# EasyEDA Pro project qsfp-booster.epro, board PCB1
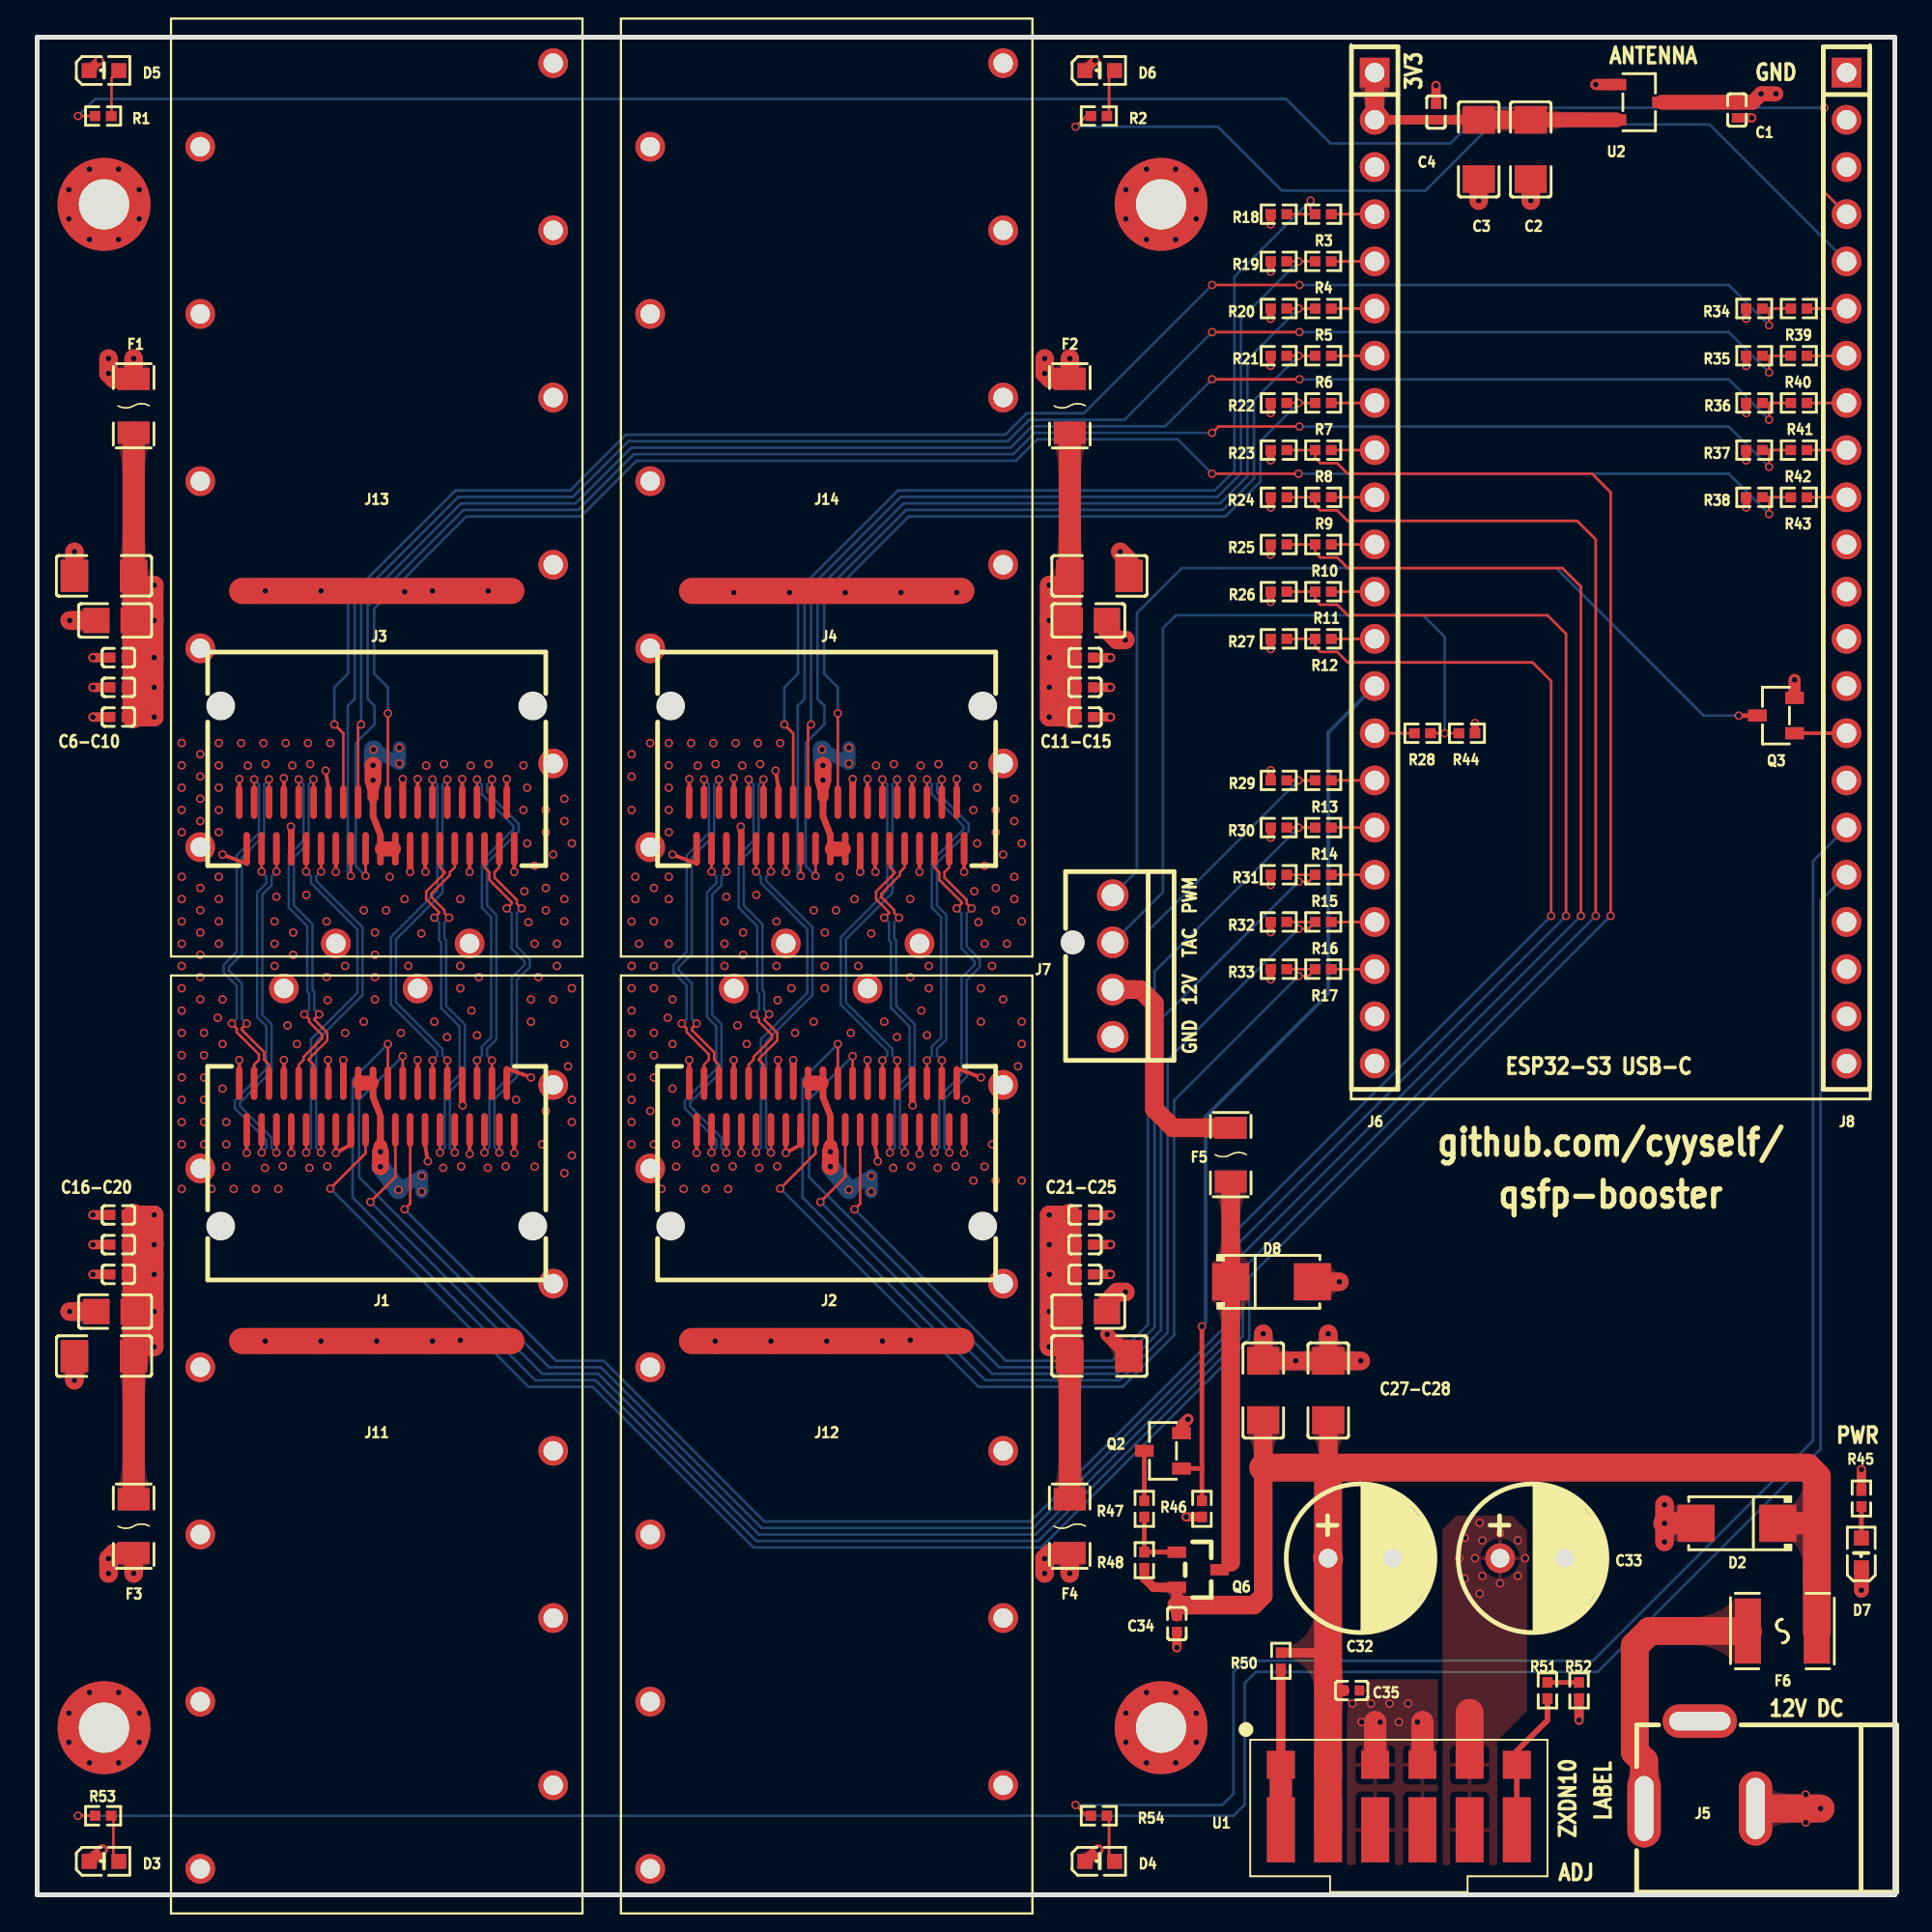
[diagram p1: board, top side]
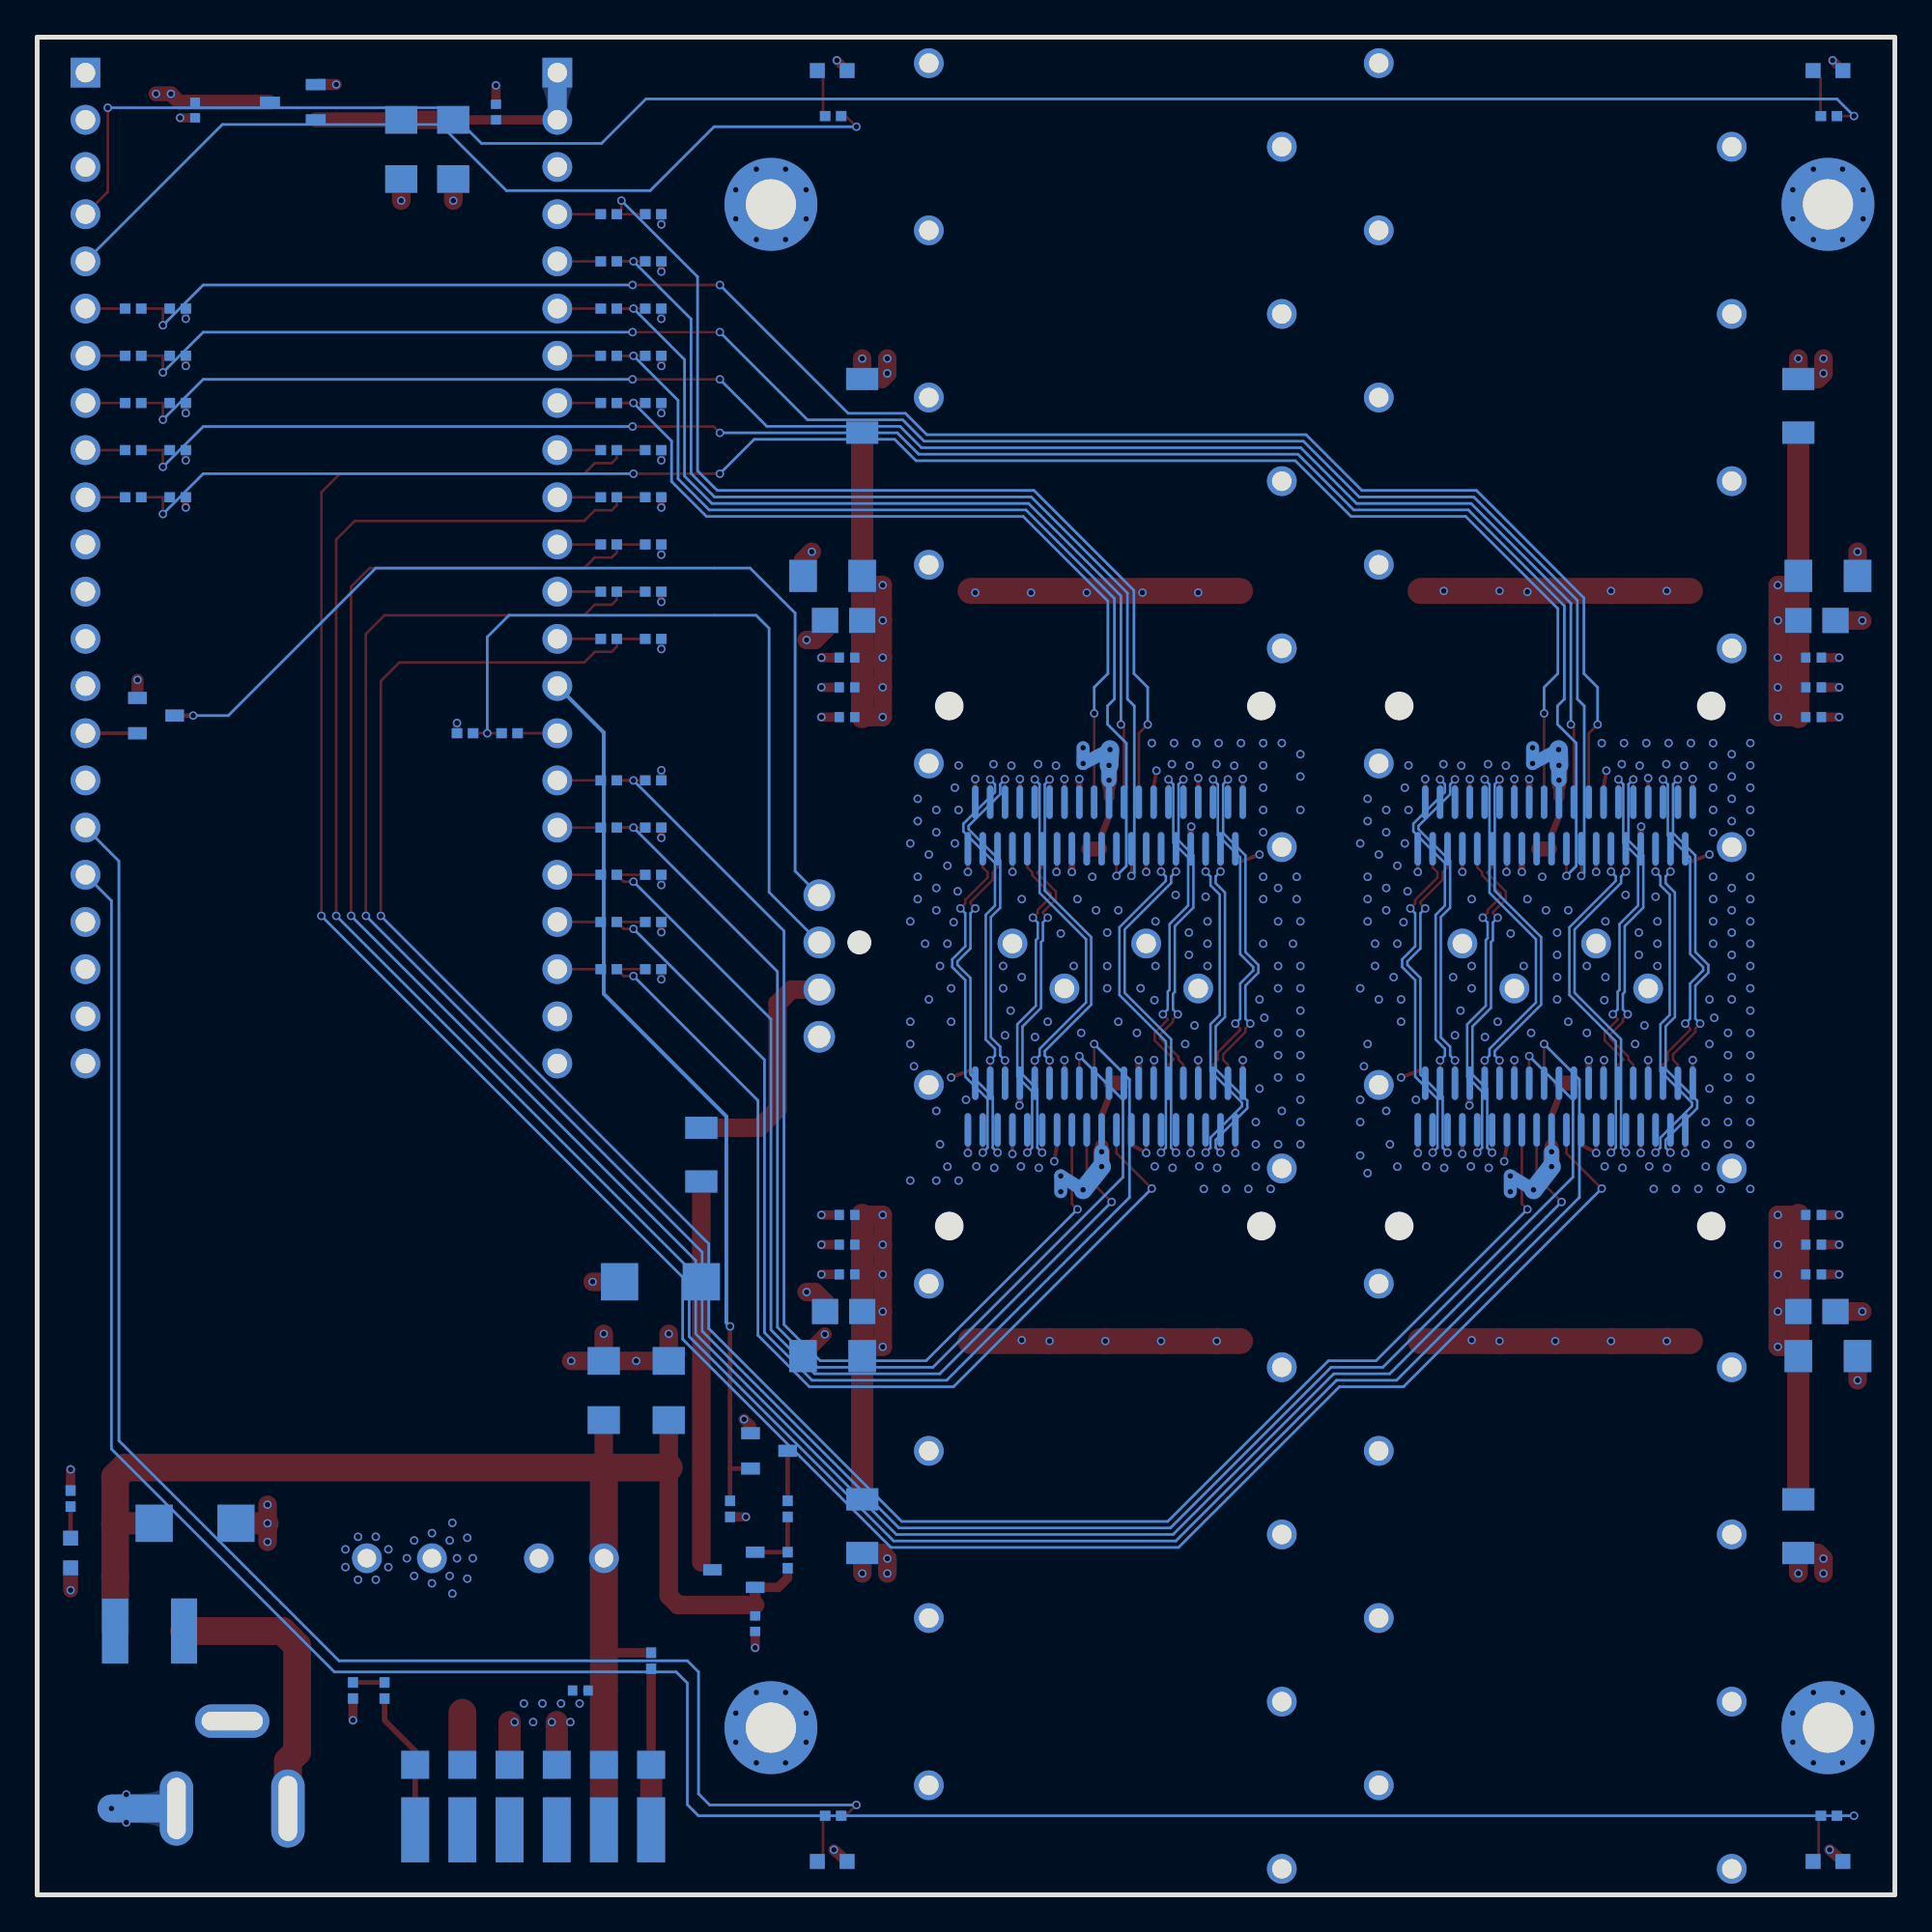
[diagram p2: board, bottom side, seen from below]

Outline 100 x 100 mm; copper layers: Top Layer, Inner1, Inner2, Bottom Layer. Coordinates in mm from the lower left corner of the outline.
Outline path: 0,100 100,100 100,0 0,0 0,100
Stack: Top Layer 0.035mm / Dielectric1 1.51mm FR4 er 4.5 / Bottom Layer 0.035mm

## Design rules (mm)
spacing copperThickness1oz (default): track to track 0.102, other pairs 0.152 to 0.3
spacing copperThickness2oz: track to track 0.203, other pairs 0.152 to 0.3
track width copperThickness1oz (default): min 0.09, default 0.2, max 2.54
track width copperThickness2oz: min 0.203, default 0.254, max 2.54
track width power: min 0.09, default 0.5, max 2.54
differential pair differentialPair (default): width min 0.13, default 0.13, max 0.13; gap min 0.15, default 0.15
net VCC_OPT1 uses power
net VCC_OPT2 uses power
net +12V uses power
net +3V3 uses power
net +12V_JACK uses power
net VCC_DAC1 uses power
net VCC_DAC2 uses power

## Placement (name value [footprint] x y rotation side)
C1  100nF  [C0402]  91.5 96.08 270 top
C2  47uF  [C1206]  80.4 93.96 270 top
C3  47uF  [C1206]  77.6 93.96 270 top
C4  100nF  [C0402]  75.3 95.97 90 top
C6  47uF  [C1206]  3.6 71 180 top
C7  10uF  [C0805]  4.19 68.6 180 top
C8  100nF  [C0402]  4.38 66.6 180 top
C9  100nF  [C0402]  4.37 65 180 top
C10  100nF  [C0402]  4.37 63.4 180 top
C11  47uF  [C1206]  57.18 71 0 top
C12  10uF  [C0805]  56.59 68.6 0 top
C13  100nF  [C0402]  56.41 66.6 0 top
C14  100nF  [C0402]  56.41 65 0 top
C15  100nF  [C0402]  56.41 63.4 0 top
C16  100nF  [C0402]  4.37 36.6 180 top
C17  100nF  [C0402]  4.37 35 180 top
C18  100nF  [C0402]  4.38 33.4 180 top
C19  10uF  [C0805]  4.19 31.4 180 top
C20  47uF  [C1206]  3.6 29 180 top
C21  100nF  [C0402]  56.4 36.6 0 top
C22  100nF  [C0402]  56.4 35 0 top
C23  100nF  [C0402]  56.4 33.4 0 top
C24  10uF  [C0805]  56.58 31.4 0 top
C25  47uF  [C1206]  57.18 29 0 top
C27  22uF  [C1206]  66 27.15 90 top
C28  22uF  [C1206]  69.5 27.15 90 top
C32  470uF  [CAP-TH_BD8.0-P3.50-D1.0-FD]  71.24 18.12 0 top
C33  470uF  [CAP-TH_BD8.0-P3.50-D1.0-FD]  80.5 18.12 0 top
C34  100nF  [C0402]  61.35 14.6 270 top
C35  100nF  [C0402]  70.76 11 0 top
D2  D  [SMA_L4.3-W2.6-LS5.2-RD]  91.5 20 180 top
D3  KT-0603W  [LED0603-R-RD_WHITE]  3.6 1.8 0 top
D4  KT-0603W  [LED0603-R-RD_WHITE]  57.2 1.8 0 top
D5  KT-0603W  [LED0603-R-RD_WHITE]  3.6 98.2 0 top
D6  KT-0603W  [LED0603-R-RD_WHITE]  57.2 98.2 0 top
D7  KT-0603W  [LED0603-R-RD_WHITE]  98.2 18.4 90 top
D8  D  [SMA_L4.3-W2.6-LS5.2-RD]  66.45 33 0 top
F1  Polyfuse  [F1206]  5.19 80.16 270 top
F2  Polyfuse  [F1206]  55.59 80.16 270 top
F3  Polyfuse  [F1206]  5.19 19.84 90 top
F4  Polyfuse  [F1206]  55.58 19.84 90 top
F5  SMD1206-100C-24V  [F1206]  64.25 39.85 90 top
F6  SMD1812P260TF/16  [F1812]  93.95 14.2 0 top
J1  QSFP28_Receptacle  [CONN-SMD_QSFP-1888971-1]  18.28 42.44 0 top
J2  QSFP28_Receptacle  [CONN-SMD_QSFP-1888971-1]  42.5 42.44 0 top
J3  QSFP28_Receptacle  [CONN-SMD_QSFP-1888971-1]  18.28 57.56 180 top
J4  QSFP28_Receptacle  [CONN-SMD_QSFP-1888971-1]  42.5 57.56 180 top
J5  Barrel_Jack_Switch  [DC-IN-TH_DC-005-5A-2.0]  89.5 7 180 top
J6  HC-PM254-8.5H-1x22PZ  [HDR-TH_22P-P2.54-V-F]  72 71.42 270 top
J7  Fan_4pin  [CONN-TH_47053-1000]  57.9 50 270 top
J8  HC-PM254-8.5H-1x22PZ  [HDR-TH_22P-P2.54-V-F]  97.4 71.42 270 top
J11  CAGE_DAC1  [QSFP_Cage_SFF8663]  18.28 36 0 top
J12  CAGE_DAC2  [QSFP_Cage_SFF8663]  42.5 36 0 top
J13  CAGE_OPT1  [QSFP_Cage_SFF8663]  18.28 64 180 top
J14  CAGE_OPT2  [QSFP_Cage_SFF8663]  42.5 64 180 top
NOREF  -  [Pad_e207]  3.6 9 0 top
NOREF#2  -  [Pad_e208]  3.6 91 0 top
NOREF#3  -  [Pad_e210]  60.5 91 0 top
NOREF#4  -  [Pad_e209]  60.5 9 0 top
Q2  NMOS_GSD  [SOT-23-3_L2.9-W1.3-P1.90-LS2.4-BR]  60.6 23.9 0 top
Q3  NMOS_GSD  [SOT-23-3_L2.9-W1.3-P1.90-LS2.4-BR]  93.6 63.48 0 top
Q6  AO3407A  [SOT-23_L2.9-W1.3-P1.90-LS2.4-BR]  62.5 17.5 180 top
R1  330Ω  [R0402]  3.55 95.75 0 top
R2  330Ω  [R0402]  57.15 95.75 0 top
R3  100Ω  [R0402]  69.23 90.47 0 top
R4  100Ω  [R0402]  69.23 87.93 0 top
R5  100Ω  [R0402]  69.23 85.39 0 top
R6  100Ω  [R0402]  69.23 82.85 0 top
R7  100Ω  [R0402]  69.23 80.31 0 top
R8  100Ω  [R0402]  69.23 77.77 0 top
R9  100Ω  [R0402]  69.23 75.23 0 top
R10  100Ω  [R0402]  69.23 72.69 0 top
R11  100Ω  [R0402]  69.23 70.15 0 top
R12  100Ω  [R0402]  69.23 67.61 0 top
R13  100Ω  [R0402]  69.23 59.99 0 top
R14  100Ω  [R0402]  69.23 57.45 0 top
R15  100Ω  [R0402]  69.23 54.91 0 top
R16  100Ω  [R0402]  69.23 52.37 0 top
R17  100Ω  [R0402]  69.23 49.83 0 top
R18  4.7kΩ  [R0402]  66.83 90.47 0 top
R19  4.7kΩ  [R0402]  66.83 87.93 0 top
R20  4.7kΩ  [R0402]  66.83 85.39 0 top
R21  4.7kΩ  [R0402]  66.83 82.85 0 top
R22  4.7kΩ  [R0402]  66.83 80.31 0 top
R23  4.7kΩ  [R0402]  66.83 77.77 0 top
R24  4.7kΩ  [R0402]  66.83 75.23 0 top
R25  4.7kΩ  [R0402]  66.83 72.69 0 top
R26  4.7kΩ  [R0402]  66.83 70.15 0 top
R27  4.7kΩ  [R0402]  66.83 67.61 0 top
R28  4.7kΩ  [R0402]  74.57 62.53 180 top
R29  4.7kΩ  [R0402]  66.83 59.99 0 top
R30  4.7kΩ  [R0402]  66.83 57.45 0 top
R31  4.7kΩ  [R0402]  66.83 54.91 0 top
R32  4.7kΩ  [R0402]  66.83 52.37 0 top
R33  4.7kΩ  [R0402]  66.83 49.83 0 top
R34  4.7kΩ  [R0402]  92.43 85.39 0 top
R35  4.7kΩ  [R0402]  92.43 82.85 0 top
R36  4.7kΩ  [R0402]  92.43 80.31 0 top
R37  4.7kΩ  [R0402]  92.43 77.77 0 top
R38  4.7kΩ  [R0402]  92.43 75.23 0 top
R39  100Ω  [R0402]  94.83 85.39 0 top
R40  100Ω  [R0402]  94.83 82.85 0 top
R41  100Ω  [R0402]  94.83 80.31 0 top
R42  100Ω  [R0402]  94.83 77.77 0 top
R43  100Ω  [R0402]  94.83 75.23 0 top
R44  4.7kΩ  [R0402]  76.97 62.53 180 top
R45  330Ω  [R0402]  98.2 21.33 270 top
R46  4.7kΩ  [R0402]  62.7 20.78 270 top
R47  4.7kΩ  [R0402]  59.6 20.78 90 top
R48  4.7kΩ  [R0402]  59.6 18.02 270 top
R50  4.7kΩ  [R0402]  66.95 12.6 270 top
R51  330Ω  [R0402]  81.3 11 90 top
R52  47Ω  [R0402]  83 11 270 top
R53  330Ω  [R0402]  3.55 4.26 0 top
R54  330Ω  [R0402]  57.15 4.26 0 top
U1  ZXDN10S1205SAW  [COMM-SMD_ZXDN10S1205SAW]  73.3 5.25 0 top
U2  CH213K  [SOT-23-3_L2.9-W1.6-P1.90-LS2.8-BR]  86.24 96.5 180 top

## Footprints (pads in the part's own frame, mm; a bottom-side part is the same pattern mirrored in y, then rotated)
C0402
  rect 0.5x0.54 hole 0.001: 1(-0.42,0) 2(0.42,0)
C0805
  rect 1.41x1.35 hole 0.001: 1(-1,0) 2(1,0)
C1206
  rect 1.485x1.728 hole 0.001: 1(-1.593,0) 2(1.593,0)
CAP-TH_BD8.0-P3.50-D1.0-FD
  round 1.6 hole 1: 1(-1.75,0) 2(1.75,0)
COMM-SMD_ZXDN10S1205SAW
  rect 1.5x1.5 hole 0.001: 1(-6.35,1.75) 2(-3.81,1.75) 3(-1.27,1.75) 4(1.27,1.75) 5(3.81,1.75) 6(6.35,1.75)
  rect 1.5x3.5 hole 0.001: 1(-6.35,-1.75) 2(-3.81,-1.75) 3(-1.27,-1.75) 4(1.27,-1.75) 5(3.81,-1.75) 6(6.35,-1.75)
CONN-SMD_QSFP-1888971-1
  oval 0.35x1.8 hole 0.001: 1(-7,-1.255) 2(-6.2,-1.255) 3(-5.4,-1.255) 4(-4.6,-1.255) 5(-3.8,-1.255) 6(-3,-1.255) 7(-2.2,-1.255) 8(-1.4,-1.255) 9(-0.6,-1.255) 10(0.2,-1.255) 11(1,-1.255) 12(1.8,-1.255) 13(2.6,-1.255) 14(3.4,-1.255) 15(4.2,-1.255) 16(5,-1.255) 17(5.8,-1.255) 18(6.6,-1.255) 19(7.4,-1.255) 20(7,1.255) 21(6.2,1.255) 22(5.4,1.255) 23(4.6,1.255) 24(3.8,1.255) 25(3,1.255) 26(2.2,1.255) 27(1.4,1.255) 28(0.6,1.255) 29(-0.2,1.255) 30(-1,1.255) 31(-1.8,1.255) 32(-2.6,1.255) 33(-3.4,1.255) 34(-4.2,1.255) 35(-5,1.255) 36(-5.8,1.255) 37(-6.6,1.255) 38(-7.4,1.255)
CONN-TH_47053-1000
  round 1.7 hole 1.2: 1(3.81,0) 2(1.27,0) 3(-1.27,0) 4(-3.81,0)
DC-IN-TH_DC-005-5A-2.0
  oval 1.8x4.2 hole 1x3.5: 1(3,2.352)
  oval 1.8x4 hole 1x3.3: 2(-3,2.352)
  oval 4x1.8 hole 3.3x1: 3(-0.001,-2.352)
F1206
  rect 1.19x1.728 hole 0.001: 1(-1.445,0) 2(1.445,0)
F1812
  rect 1.407x3.499 hole 0.001: 1(-1.853,0) 2(1.853,0)
HDR-TH_22P-P2.54-V-F
  rect 1.6x1.6 hole 1.05: 1(-26.67,0)
  round 1.6 hole 1.05: 2(-24.13,0) 3(-21.59,0) 4(-19.05,0) 5(-16.51,0) 6(-13.97,0) 7(-11.43,0) 8(-8.89,0) 9(-6.35,0) 10(-3.81,0) 11(-1.27,0) 12(1.27,0) 13(3.81,0) 14(6.35,0) 15(8.89,0) 16(11.43,0) 17(13.97,0) 18(16.51,0) 19(19.05,0) 20(21.59,0) 21(24.13,0) 22(26.67,0)
LED0603-R-RD_WHITE
  rect 0.8x0.8 hole 0.001: 1(0.8,0) 2(-0.8,0)
Pad_e207
  round 5.002 hole 2.7: MH1(0,0)
Pad_e208
  round 5.002 hole 2.7: MH2(0,0)
Pad_e209
  round 5 hole 2.7: MH3(0,0)
Pad_e210
  round 5.002 hole 2.7: MH4(0,0)
QSFP_Cage_SFF8663
  round 1.6 hole 1.05: 1(-9.5,3.1) 1(-9.5,-7.6) 1(-9.5,-16.6) 1(-9.5,-25.6) 1(-9.5,-34.6) 1(-5,12.79) 1(2.2,12.79) 1(9.5,7.6) 1(9.5,-3.1) 1(9.5,-12.1) 1(9.5,-21.1) 1(9.5,-30.1)
R0402
  rect 0.566x0.54 hole 0.001: 1(-0.433,0) 2(0.433,0)
SMA_L4.3-W2.6-LS5.2-RD
  rect 2x2 hole 0.001: 1(-2.2,0) 2(2.2,0)
SOT-23-3_L2.9-W1.3-P1.90-LS2.4-BR
  rect 1x0.65 hole 0.001: 1(1,-0.95) 2(1,0.95) 3(-1,0)
SOT-23-3_L2.9-W1.6-P1.90-LS2.8-BR
  rect 1.07x0.6 hole 0.001: 1(1.235,-0.95) 2(1.235,0.95) 3(-1.235,0)
SOT-23_L2.9-W1.3-P1.90-LS2.4-BR
  rect 1x0.6 hole 0.001: 1(1.15,-0.95) 2(1.15,0.95) 3(-1.15,0)

## Nets
As in the schematic, except:
+12V: C27.1 C28.1 C32.1 C34.1 C35.1 D2.1 F6.2 Q6.2 R48.2 R50.1 U1.2
GND: C1.2 C2.2 C3.2 C4.2 C6.2 C7.2 C8.2 C9.2 C10.2 C11.2 C12.2 C13.2 C14.2 C15.2 C16.2 C17.2 C18.2 C19.2 C20.2 C21.2 C22.2 C23.2 C24.2 C25.2 C27.2 C28.2 C32.2 C33.2 C34.2 C35.2 D2.2 D3.2 D4.2 D5.2 D6.2 D7.2 D8.2 J1.1 J1.4 J1.7 J1.8 J1.13 J1.16 J1.19 J1.20 J1.23 J1.26 J1.31 J1.32 J1.35 J1.38 J2.1 J2.4 J2.7 J2.8 J2.13 J2.16 J2.19 J2.20 J2.23 J2.26 J2.31 J2.32 J2.35 J2.38 J3.1 J3.4 J3.7 J3.8 J3.13 J3.16 J3.19 J3.20 J3.23 J3.26 J3.31 J3.32 J3.35 J3.38 J4.1 J4.4 J4.7 J4.8 J4.13 J4.16 J4.19 J4.20 J4.23 J4.26 J4.31 J4.32 J4.35 J4.38 J5.2 J5.3 J6.22 J7.1 J8.1 J8.21 J8.22 J11.1 J12.1 J13.1 J14.1 NOREF.MH1 NOREF#2.MH2 NOREF#3.MH4 NOREF#4.MH3 Q2.2 Q3.2 R46.2 R52.2 U1.3 U1.4 U2.1
FAN_12V_Q: D8.1 F5.1 Q6.3

Pads without a net: J6 3 21; J8 2 3 11 12 13 14 16 19 20

## Via types
v1: diameter 0.452, hole 0.3, Top Layer to Bottom Layer, 547 vias
v2: diameter 0.452, hole 0.299, Top Layer to Bottom Layer, 60 vias
v3: diameter 0.45, hole 0.3, Top Layer to Bottom Layer, 51 vias

## Routing (per net, layer and track width the routed paths; a pad name or vN(x,y) marks a point on that pad's centre or on a via; arc(x,y) is an arc through that point)
+3V3: length 35.3
  Top Layer w0.4: R32.1 v3(66.4,51.82) ; R35.1 v3(92,82.3) ; R33.1 v3(66.4,49.28) ; R19.1 v3(66.4,87.38) ; R36.1 v3(92,79.76) ; R18.1 v3(66.4,89.92) ; R25.1 v3(66.4,72.14) ; R29.1 v3(66.4,60.54) ; R38.1 v3(92,74.68) ; R44.1 v3(77.4,63.08) ; R23.1 v3(66.4,77.22) ; R31.1 v3(66.4,54.36) ; R20.1 v3(66.4,84.84) ; R21.1 v3(66.4,82.3) ; R34.1 v3(92,84.84) ; R37.1 v3(92,77.22) ; R30.1 v3(66.4,56.9) ; R26.1 v3(66.4,69.6) ; R27.1 v3(66.4,67.06) ; R22.1 v3(66.4,79.76) ; R24.1 v3(66.4,74.68)
  Top Layer w0.5: 98.2,21.76 v3(98.2,22.9)
  Top Layer w0.8: 87.47,96.5 C1.1 92.35,96.5 v1(92.8,96.95) v1(93.6,96.95)
  Top Layer w1: v1(5.19,17.3) 5.19,18.4 4.14,18.4 v1(3.84,18.1) v1(3.84,17.3) ; v1(54.24,82.7) v1(54.24,81.9) 54.54,81.6 F2.1 v1(55.59,82.7) ; v1(55.58,17.3) F4.1 54.53,18.4 v1(54.23,18.1) v1(54.23,17.3) ; v1(5.19,82.7) 5.19,81.6 4.14,81.6 v1(3.84,81.9) v1(3.84,82.7)
  Top Layer w1.5: 77.11,7 77.11,9.8
  vias: v2(76.55,18.12) v2(76.84,19.22) v2(76.84,17.02) v2(77.4,18.12) v2(77.65,20.03) v2(77.65,16.22) v2(77.79,19.07) v2(77.79,17.16) v2(78.75,19.47) v2(78.75,16.77) v2(79.71,19.07) v2(79.71,17.16) v2(80.1,18.12)
+12V: length 84.2
  Top Layer w0.5: 66.95,13.03 69.49,13.03 ; 61.35,16.55 60.1,16.55 59.6,17.05 59.6,17.58
  Top Layer w0.6: 69.49,11 C35.1 ; 61.35,16.55 61.35,15.02
  Top Layer w1: 66,25.56 66,16.1 65.5,15.6 61.35,15.6 ; 69.5,25.56 69.5,23
  Top Layer w1.2: 93.7,20 95.8,20
  Top Layer w1.5: 69.49,23 69.49,18.12 69.49,13.03 U1.2 U1.2 ; 69.49,23 95.3,23 95.8,22.5 95.8,17.1 F6.2 ; 69.49,23 66,23
+12V_JACK: length 15.4
  Top Layer w1.5: 92.09,14.2 86.8,14.2 86,13.4 86,7.7 86.5,7.2 86.5,4.65
GND: length 198.3
  Top Layer w0.2: 37.5,59.62 v1(37.5,60.11) ; 13.68,40.38 v1(13.68,39.94) ; 25.68,55.51 v1(25.68,55.06) ; 20.48,59.62 v1(20.48,60.06) ; 47.1,59.62 v1(47.1,60.06) ; 37.5,44.49 v1(37.5,44.94) ; 16.88,40.38 16.08,39.94 ; 16.08,39.94 16.08,40.38 ; 16.08,39.94 v1(16.08,39.94) ; 13.28,44.49 v1(13.28,44.94) ; 49.5,44.49 v1(50.8,44) ; 40.3,39.94 41.1,40.38 ; 40.3,39.94 v1(40.3,39.94) ; 40.3,39.94 40.3,40.38 ; 37.9,40.38 v1(37.9,39.94) ; 15.68,59.62 v1(15.53,60.51) ; 20.88,55.51 v1(20.91,55.06) ; 49.9,40.38 v1(49.9,39.94) ; 35.1,59.62 v1(35.1,60.06) ; 23.28,55.51 v1(23.28,55.06) ; 20.88,40.38 v1(21.03,39.49) ; 39.9,59.62 v1(39.75,60.51) ; 40.3,55.51 v1(40.3,55.06) ; 25.68,40.38 v1(25.68,39.94) ; 11.28,40.38 v1(11.28,39.94) ; 49.9,55.51 v1(49.9,55.06) ; 16.08,55.51 v1(16.08,55.06) ; 47.5,40.38 v1(47.5,39.89) ; 23.28,40.38 v1(23.28,39.89) ; 20.48,44.49 v1(20.48,44.94) ; 49.5,59.62 v1(49.5,60.06) ; 25.28,44.49 v1(26.58,44) ; 45.1,55.51 v1(45.13,55.06) ; 22.88,59.62 v1(22.88,60.06) ; 10.88,44.49 v1(10.88,44.94) ; 44.7,59.62 v1(44.7,60.06) ; 35.5,40.38 v1(35.5,39.94) ; 45.1,40.38 v1(45.25,39.49) ; 11.28,55.51 v1(9.98,56) ; 10.88,59.62 v1(10.88,60.06) ; 35.5,55.51 v1(34.2,56) ; 25.28,59.62 v1(25.28,60.06) ; 39.9,44.49 v1(39.87,44.94) ; 15.68,44.49 v1(15.65,44.94) ; 44.7,44.49 v1(44.7,44.94) ; 47.5,55.51 v1(47.5,55.06) ; 13.28,59.62 v1(13.28,60.11) ; 35.1,44.49 v1(35.1,44.94)
  Top Layer w0.25: J2.13 45.1,40.38 ; J1.38 10.88,44.49 ; J3.19 10.88,59.62 ; J2.20 49.5,44.49 ; 13.28,43.69 13.28,44.49 ; 47.5,56.31 47.5,55.51 ; J2.1 35.5,40.38 ; 49.5,58.82 49.5,59.62 ; J1.20 25.28,44.49 ; J4.38 49.9,55.51 ; 47.1,58.82 47.1,59.62 ; 37.5,43.69 37.5,44.49 ; 47.5,41.18 47.5,40.38 ; 39.9,58.82 39.9,59.62 ; J2.32 39.9,44.49 ; J1.23 22.88,42.89 ; J2.38 35.1,44.49 ; J2.23 47.1,42.89 ; J1.7 16.08,40.38 ; J1.13 20.88,40.38 ; J4.32 45.1,55.51 ; J3.4 22.88,59.62 ; J1.32 15.68,44.49 ; J1.19 25.68,40.38 ; 16.08,56.31 16.08,55.51 ; 13.68,56.31 13.68,57.11 ; 37.5,58.82 37.5,59.62 ; J4.26 40.3,55.51 ; J2.7 40.3,40.38 ; 35.1,58.82 35.1,59.62 ; J3.7 20.48,59.62 ; J1.1 11.28,40.38 ; 23.28,41.18 23.28,40.38 ; 11.28,56.31 11.28,55.51 ; J3.1 25.28,59.62 ; J2.19 49.9,40.38 ; J2.26 44.7,44.49 ; J4.20 35.5,55.51 ; 20.88,56.31 20.88,55.51 ; 44.7,58.82 44.7,59.62 ; J3.13 15.68,59.62 ; J1.4 13.68,40.38 ; J1.26 20.48,44.49 ; 25.68,56.31 25.68,55.51 ; 13.28,58.82 13.28,59.62 ; J4.23 37.9,57.11 ; 23.28,56.31 23.28,55.51 ; J2.4 37.9,40.38
  Top Layer w0.35: J1.8 16.88,40.38 ; 47.1,42.89 v1(47.12,42.5) ; v1(19.68,60.06) J3.8 ; J2.8 41.1,40.38 ; v1(43.9,60.06) 43.9,58.82 ; v1(20.08,55.06) 20.08,56.31 ; 13.68,57.11 v1(13.66,57.5) ; v1(44.3,55.06) J4.31 ; 22.88,42.89 v1(22.91,42.5) ; v1(40.7,44.94) J2.31 ; v1(16.48,44.94) J1.31 ; 37.9,57.11 v1(37.88,57.5)
  Top Layer w0.5: R46.2 v3(61.85,20.34) ; D6.2 v1(56.95,98.75) ; 56.83,33.4 v2(57.78,33.4) ; C14.2 v2(57.78,65) ; 83,10.57 v1(83,9.4) ; 56.83,36.6 v2(57.78,36.6) ; 3.95,65 v2(3,65) ; 75.3,96.39 v3(75.3,97.4) ; D5.2 v1(3.35,98.75) ; 3.95,35 v2(3,35) ; C13.2 v2(57.78,66.6) ; 3.95,36.6 v2(3,36.6) ; 56.83,63.4 v2(57.78,63.4) ; 3.95,63.4 v2(3,63.4) ; C8.2 v2(3,66.6) ; 56.83,35 v2(57.78,35) ; 91.5,95.66 v1(92.3,95.66) ; 61.35,14.18 v1(61.35,13.3) ; C18.2 v2(3,33.4)
  Top Layer w0.6: D3.2 v1(3.51,2.42) ; D4.2 v1(57.11,2.42) ; v3(61.95,25.6) 61.6,25.25 61.6,24.85 ; 85,97.45 v1(83.9,97.45)
  Top Layer w0.65: Q3.2 v3(94.6,65.4)
  Top Layer w0.75: C25.2 v3(57.6,30.18)
  Top Layer w0.8: 98.2,17.6 v3(98.2,16.4)
  Top Layer w1: 69.5,28.74 v3(69.5,30.2) ; 69.5,28.74 v1(71.25,28.74) ; 69.5,28.74 v1(67.75,28.74) 66,28.74 v3(66,30.2) ; 2.01,70.7 v2(2.01,72.3) ; v2(58.3,72.3) 58.78,71.82 58.78,70.7 ; 77.6,92.36 v3(77.6,91.2) ; D8.2 v3(70.1,33) ; 3.19,68.6 v2(1.75,68.6) ; v2(58.58,67.55) 58.14,67.55 57.59,68.1 57.59,68.6 ; C2.2 v3(80.4,91.2) ; v2(58.58,32.45) 58.14,32.45 57.59,31.9 57.59,31.4 ; v3(87.6,21) v3(87.6,20) v3(87.6,19) ; 3.19,31.4 v2(1.75,31.4) ; 2.01,29.3 v2(2.01,27.7)
  Top Layer w1.2: 89.3,20 v3(87.6,20) ; 72.03,7 72.03,9.3 ; 74.57,7 74.57,9.3
  Top Layer w1.4: 35.25,29.81 v1(36.5,29.81) v3(39.5,29.81) v3(42.5,29.81) v3(45.5,29.81) 49.75,29.81 ; 25.53,29.81 v1(21.28,29.81) v1(18.28,29.81) v1(15.28,29.81) v1(12.28,29.81) 11.03,29.81 ; 11.03,70.19 v1(12.28,70.19) v1(15.28,70.19) v1(21.28,70.19) v1(24.28,70.19) 25.53,70.19 ; 35.25,70.19 49.75,70.19
  Top Layer w1.5: 92.5,4.65 v1(96,4.65)
  Bottom Layer w1.5: 92.5,4.65 v1(96,4.65)
  vias: v1(1.71,91.78) v1(1.71,90.22) v1(1.71,9.78) v1(1.71,8.22) v1(2.82,92.89) v1(2.82,89.11) v1(2.82,10.89) v1(2.82,7.11) v1(4.39,92.89) v1(4.39,89.11) v1(4.39,10.89) v1(4.39,7.11) v1(5.49,91.78) v1(5.49,90.22) v1(5.49,9.78) v1(5.49,8.22) v1(7.78,62) v1(7.78,60.8) v1(7.78,59.6) v1(7.78,58.4) v1(7.78,57.2) v1(7.78,54.8) v1(7.78,53.6) v1(7.78,52.4) v1(7.78,51.2) v1(7.78,50) v1(7.78,48.8) v1(7.78,47.6) v1(7.78,46.4) v1(7.78,45.2) v1(7.78,44) v1(7.78,42.8) v1(7.78,41.6) v1(7.78,40.4) v1(7.78,38) v1(8.78,61.4) v1(8.78,60.2) v1(8.78,59) v1(8.78,57.8) v1(8.78,54.2) v1(8.78,53) v1(8.78,51.8) v1(8.78,50.6) v1(8.78,49.4) v1(8.78,48.2) v1(8.98,46.4) v1(8.98,45.2) v1(8.98,44) v1(8.98,42.8) v1(8.98,41.6) v1(8.98,40.4) v1(9.38,38) v1(9.72,47.21) v1(9.78,62) v1(9.78,60.8) v1(9.78,59.6) v1(9.78,58.4) v1(9.78,57.2) v1(9.78,54.8) v1(9.78,53.6) v1(9.78,52.4) v1(9.78,51.2) v1(9.98,48.2) v1(9.98,45.8) v1(9.98,43.4) v1(10.18,41.6) v1(10.18,40.4) v1(10.18,39.2) v1(10.58,38) v1(10.98,62) v1(11.34,60.79) v1(11.78,38) v1(12.18,62) v1(12.3,60.86) v1(12.26,39.14) v1(12.78,52.4) v1(12.78,51.2) v1(12.78,50) v1(12.88,53.73) v1(12.98,38) v1(13.22,39.21) v1(13.38,62) v1(13.48,46.8) v1(13.74,60.79) v1(13.78,51.8) v1(13.78,50.6) v1(13.98,45.8) v1(14.49,53.83) v1(14.58,62) v1(14.7,60.86) v1(14.66,39.14) v1(15.58,52.4) v1(15.58,49.4) v1(15.64,48.16) v1(15.62,39.21) v1(15.78,62) v1(16.58,50) v1(16.58,46.4) v1(17.58,53) v1(17.58,47) v1(18.18,51.8) v1(18.18,50.6) v1(18.18,49.4) v1(18.18,48.2) v1(18.78,53) v1(18.98,54.8) v1(19.58,46.4) v1(19.78,70.14) v1(19.78,53.6) v1(19.98,50) v1(20.68,51.75) v1(20.94,60.79) v1(21.38,47) v1(21.9,60.86) v1(21.86,39.14) v1(22.07,46.17) v1(22.78,53.6) v1(22.78,50) v1(22.78,48.8) v1(22.82,39.21) v1(22.78,29.86) v1(23.34,60.79) v1(23.38,47.6) v1(23.68,46.27) v1(23.78,49.4) v1(24.3,60.86) v1(24.26,39.14) v1(25.22,39.21) v1(25.78,42.8) v1(26.18,60.8) v1(26.18,58.4) v1(26.23,54.02) v1(26.38,59.6) v1(26.38,56.6) v1(26.45,52.36) v1(26.58,48.2) v1(26.58,47) v1(26.78,55.4) v1(26.78,51.2) v1(26.78,39.2) v1(26.98,49.4) v1(27.18,40.4) v1(27.38,58.4) v1(27.38,57.2) v1(27.38,54.2) v1(27.38,53) v1(27.38,42.2) v1(27.78,56) v1(27.78,48.2) v1(27.98,51.2) v1(27.98,50) v1(28.38,59) v1(28.38,57.8) v1(28.38,54.8) v1(28.38,53.6) v1(28.38,52.4) v1(28.38,45.8) v1(28.38,38.85) v1(28.58,44.6) v1(28.78,56.6) v1(28.78,48.8) v1(28.78,42.8) v1(28.78,41.6) v1(28.78,39.8) v1(32,61.4) v1(32,60.2) v1(32,58.4) v1(32,52.4) v1(32,50) v1(32,48.8) v1(32,47.6) v1(32,46.4) v1(32,45.2) v1(32,44) v1(32,42.8) v1(32,41.6) v1(32,40.4) v1(32.2,54.8) v1(32.2,53.6) v1(32.4,51.2) v1(33,62) v1(33,42.2) v1(33.2,54.2) v1(33.2,52.4) v1(33.2,50) v1(33.2,48.8) v1(33.2,46.4) v1(33.2,45.2) v1(33.2,44) v1(33.2,40.4) v1(33.6,38) v1(33.94,47.21) v1(34,62) v1(34,60.8) v1(34,59.6) v1(34,58.4) v1(34,57.2) v1(34,54.8) v1(34,53.6) v1(34,51.2) v1(34.2,48.2) v1(34.2,45.8) v1(34.2,43.4) v1(34.4,41.6) v1(34.4,40.4) v1(34.4,39.2) v1(34.8,38) v1(35.2,62) v1(35.56,60.79) v1(36,38) v1(36.4,62) v1(36.52,60.86) v1(36.48,39.14) v1(37,52.4) v1(37,51.2) v1(37,50) v1(37.1,53.73) v1(37.2,38) v1(37.44,39.21) v1(37.5,70.1) v1(37.6,62) v1(37.7,46.8) v1(37.96,60.79) v1(38,51.8) v1(38,50.6) v1(38.2,45.8) v1(38.71,53.83) v1(38.8,62) v1(38.92,60.86) v1(38.88,39.14) v1(39.8,52.4) v1(39.8,50) v1(39.84,39.21) v1(39.86,48.16) v1(40,62) v1(40.6,48.8) v1(40.8,46.4) v1(41.8,53) v1(41.8,47) v1(42.4,51.8) v1(42.4,50) v1(42.4,48.8) v1(43,53) v1(43.2,54.8) v1(44,53.6) v1(44.2,50) v1(44.9,51.75) v1(45.16,60.79) v1(45.6,47) v1(46.12,60.86) v1(46.08,39.14) v1(46.29,46.17) v1(47,53.6) v1(47,49.4) v1(47.04,39.21) v1(47,29.86) v1(47.56,60.79) v1(47.6,47.6) v1(47.9,46.27) v1(48,50) v1(48,48.8) v1(48.52,60.86) v1(48.48,39.14) v1(49.44,39.21) v1(50,42.8) v1(50.4,60.8) v1(50.4,58.4) v1(50.45,54.02) v1(50.4,38.45) v1(50.6,59.6) v1(50.6,56.6) v1(50.67,52.36) v1(50.8,48.8) v1(50.8,47) v1(51,55.4) v1(51,51.2) v1(51,39.2) v1(51.4,50) v1(51.4,40.4) v1(51.6,58.4) v1(51.6,57.2) v1(51.6,54.2) v1(51.6,53) v1(51.6,42.2) v1(51.6,38.45) v1(52,56) v1(52,48.2) v1(52.2,51.2) v1(52.6,59) v1(52.6,57.8) v1(52.6,54.8) v1(52.6,53.6) v1(52.8,44.6) v1(53,56.6) v1(53,52.4) v1(53,47) v1(53,45.8) v1(53,38.45) v1(58.61,91.78) v1(58.61,90.22) v1(58.61,9.78) v1(58.61,8.22) v1(59.72,92.89) v1(59.72,89.11) v1(59.72,10.89) v1(59.72,7.11) v1(61.28,92.89) v1(61.28,89.11) v1(61.28,10.89) v1(61.28,7.11) v1(62.39,91.78) v1(62.39,90.22) v1(62.39,9.78) v1(62.39,8.22) v1(70.8,10.3) v1(71.3,9.3) v1(71.8,10.3) v1(72.3,9.3) v1(72.8,10.3) v1(73.3,9.3) v1(73.8,10.3) v1(74.3,9.3) v1(95.2,5.4) v1(95.2,3.9) v2(81.09,18.6) v2(81.09,17.64) v2(81.77,19.28) v2(81.77,16.97) v2(82.73,19.28) v2(82.73,16.97) v2(83.41,18.6) v2(83.41,17.64) v3(40.5,70.1) v3(43.5,70.1) v3(43.8,46.4) v3(46.5,70.1) v3(49.5,70.1)
VCC_DAC1: length 37.7
  Top Layer w0.35: J1.10 18.48,40.3 ; 18.08,42.95 18.48,41.93 ; J1.30 17.38,43.7 ; J1.29 17.98,43.7
  Top Layer w0.5: 4.8,36.6 5.19,36.6 ; C18.1 5.19,33.4 ; 4.8,35 5.19,35
  Top Layer w0.75: 18.48,40.3 v1(18.48,40)
  Top Layer w0.8: 17.98,43.7 17.38,43.7
  Top Layer w0.9: v1(18.48,40) v1(18.48,39.2)
  Top Layer w1: v2(6.3,31.4) C19.1 ; v2(6.3,31.4) v2(6.3,33.4) ; v2(6.3,31.4) v2(6.3,29.5) 5.19,29.5 ; v2(6.3,35) v2(6.3,36.6) 5.19,36.6 ; v2(6.3,35) v2(6.3,33.4) ; v2(6.3,35) 5.19,35 ; 5.19,33.4 v2(6.3,33.4)
  Top Layer w1.2: 5.19,21.29 C19.1 5.19,36.6
  Bottom Layer w0.7: v1(19.45,37.95) v1(20.7,38.7) v1(20.7,37.85)
  Bottom Layer w0.8: v1(18.48,39.2) v1(18.48,40)
  Bottom Layer w1: v1(18.48,39.2) v1(19.45,37.95)
VCC_DAC2: length 37.7
  Top Layer w0.35: J2.10 42.7,40.3 ; 42.3,42.95 42.7,41.93 ; J2.30 41.6,43.7 ; J2.29 42.2,43.7
  Top Layer w0.5: 55.99,33.4 55.59,33.4 ; 55.99,35 55.59,35 ; 55.99,36.6 55.59,36.6
  Top Layer w0.75: 42.7,40.3 v1(42.7,40)
  Top Layer w0.8: 42.2,43.7 41.6,43.7
  Top Layer w0.9: v1(42.7,40) v1(42.7,39.2)
  Top Layer w1: v2(54.48,35) 55.59,35 ; v2(54.48,35) v2(54.48,36.6) 55.59,36.6 ; v2(54.48,35) v2(54.48,33.4) ; v2(54.48,31.4) 55.59,31.4 ; v2(54.48,31.4) v2(54.48,29.5) 55.59,29.5 ; v2(54.48,31.4) v2(54.48,33.4) ; v2(54.48,33.4) 55.59,33.4
  Top Layer w1.2: 55.59,21.29 55.59,36.6
  Bottom Layer w0.7: v1(43.7,37.95) v1(44.9,38.7) v1(44.9,37.85)
  Bottom Layer w0.8: v1(42.7,39.2) v1(42.7,40)
  Bottom Layer w1: v1(42.7,39.2) v1(43.7,37.95)
VCC_OPT1: length 37.7
  Top Layer w0.35: J3.10 18.08,59.7 ; J3.30 19.18,56.3 ; J3.29 18.58,56.3 ; 18.48,57.05 18.08,58.07
  Top Layer w0.5: C8.1 5.19,66.6 ; 4.8,63.4 5.19,63.4 ; 4.8,65 5.19,65
  Top Layer w0.6: 18.08,59.7 18.08,59.1
  Top Layer w0.75: v1(18.08,60) 18.08,59.7
  Top Layer w0.8: 19.18,56.3 18.58,56.3
  Top Layer w0.9: v1(18.08,60) v1(18.08,60.8)
  Top Layer w1: v2(6.3,68.6) C7.1 ; v2(6.3,68.6) v2(6.3,70.5) 5.19,70.5 ; v2(6.3,68.6) v2(6.3,66.6) ; v2(6.3,65) v2(6.3,63.4) 5.19,63.4 ; v2(6.3,65) 5.19,65 ; v2(6.3,65) v2(6.3,66.6) ; v2(6.3,66.6) 5.19,66.6
  Top Layer w1.2: 5.19,63.4 C7.1 5.19,78.71
  Bottom Layer w0.7: v1(18.1,61.65) v1(19.5,60.9) v1(19.5,61.75)
  Bottom Layer w0.8: v1(18.08,60.8) v1(18.08,60)
  Bottom Layer w1: v1(18.08,60.8) v1(18.1,61.65)
VCC_OPT2: length 37.7
  Top Layer w0.35: 42.7,57.05 42.3,58.07 ; 43.5,56.31 43.4,56.3 ; 42.3,58.82 42.3,59.7 ; 42.7,56.31 42.8,56.3
  Top Layer w0.5: 55.99,65 55.59,65 ; 55.99,66.6 55.59,66.6 ; C15.1 55.59,63.4
  Top Layer w0.6: 42.3,59.7 42.3,59.1
  Top Layer w0.75: v1(42.3,60) 42.3,59.7
  Top Layer w0.8: 43.4,56.3 42.8,56.3
  Top Layer w0.9: v1(42.3,60) v1(42.3,60.8)
  Top Layer w1: v2(54.48,68.6) v2(54.48,70.5) 55.59,70.5 ; v2(54.48,68.6) v2(54.48,66.6) ; v2(54.48,68.6) 55.59,68.6 ; v2(54.48,66.6) v2(54.48,65) ; v2(54.48,66.6) 55.59,66.6 ; v2(54.48,65) 55.59,65 ; v2(54.48,65) v2(54.48,63.4) 55.59,63.4
  Top Layer w1.2: 55.59,63.4 F2.2
  Bottom Layer w0.7: v1(42.25,61.65) v1(43.7,60.9) v1(43.7,61.75)
  Bottom Layer w0.8: v1(42.3,60.8) v1(42.3,60)
  Bottom Layer w1: v1(42.3,60.8) v1(42.25,61.65)
DAC1_INTL: length 139.9
  Top Layer w0.14: v1(83.9,52.7) 83.9,72.96 82.9,73.96 70.55,73.96 69.98,74.53 69.07,74.53 68.8,74.8 68.8,75.23 ; 68.8,75.23 67.26,75.23 ; 18.88,43.69 v1(18.88,45.8)
  Bottom Layer w0.14: v1(83.9,52.7) 64.9,33.7 64.9,30.06 53.9,19.05 38.71,19.05 30.06,27.7 26.82,27.7 16.98,37.54 16.98,43.9 v1(18.88,45.8)
DAC1_INTL_G: length 2.3
  Top Layer w0.14: J6.10 69.66,75.23
DAC1_PRSL: length 129.3
  Top Layer w0.14: 19.68,43.69 v1(19.68,45.15) ; v1(82.3,52.7) 82.3,67.88 81.3,68.88 70.55,68.88 69.98,69.45 69.07,69.45 68.8,69.72 68.8,70.15 ; 68.8,70.15 67.26,70.15
  Bottom Layer w0.14: v1(19.68,45.15) 17.33,42.8 17.33,38.63 27.56,28.4 30.34,28.4 39,19.75 53.6,19.75 64.2,30.34 64.2,34.6 v1(82.3,52.7)
DAC1_PRSL_G: length 2.3
  Top Layer w0.14: J6.12 69.66,70.15
DAC1_RSTL: length 138.3
  Top Layer w0.14: v1(84.7,52.7) 84.7,75.5 83.7,76.5 70.55,76.5 69.98,77.07 69.07,77.07 68.8,77.34 68.8,77.77 ; 68.8,77.77 67.26,77.77 ; J1.9 17.68,39.92 v1(15.78,38.02)
  Bottom Layer w0.14: v1(84.7,52.7) 65.25,33.25 65.25,29.91 54.04,18.7 38.56,18.7 29.9,27.35 26.45,27.35 v1(15.78,38.02)
DAC1_RSTL_G: length 2.3
  Top Layer w0.14: J6.9 69.66,77.77
DAC1_SCL: length 127.9
  Top Layer w0.14: 68.8,72.69 68.8,72.26 69.07,71.99 69.98,71.99 70.55,71.42 82.1,71.42 83.1,70.42 v1(83.1,52.7) ; v1(17.94,37.3) 19.28,38.64 J1.11 ; 68.8,72.69 67.26,72.69
  Bottom Layer w0.14: v1(83.1,52.7) 64.55,34.15 64.55,30.2 53.75,19.4 38.85,19.4 30.2,28.05 27.19,28.05 v1(17.94,37.3)
DAC1_SCL_G: length 2.3
  Top Layer w0.14: J6.11 69.66,72.69
DAC1_SDA: length 117.3
  Top Layer w0.14: J1.12 20.08,37.2 v1(19.78,36.9) ; 68.8,67.61 67.26,67.61 ; 68.8,67.61 68.8,67.18 69.07,66.91 69.98,66.91 70.55,66.34 80.5,66.34 81.5,65.34 v1(81.5,52.7)
  Bottom Layer w0.14: v1(19.78,36.9) 27.93,28.75 30.49,28.75 39.14,20.1 53.46,20.1 63.85,30.49 63.85,35.05 v1(81.5,52.7)
DAC1_SDA_G: length 2.3
  Top Layer w0.14: J6.13 69.66,67.61
DAC2_INTL: length 63.2
  Top Layer w0.14: 67.26,52.37 R16.1 ; 68.8,52.37 68.43,52 v1(67.9,52) ; 43.1,43.69 v1(43.1,45.8)
  Bottom Layer w0.14: v1(67.9,52) 60.85,44.95 60.85,30.26 58.28,27.7 51.04,27.7 41.2,37.54 41.2,43.9 v1(43.1,45.8)
DAC2_INTL_G: length 2.3
  Top Layer w0.14: R16.2 J6.19
DAC2_PRSL: length 65.2
  Top Layer w0.14: v1(67.9,57.45) R14.1 ; v1(67.9,57.45) 67.26,57.45 ; v1(67.9,57.45) 68.8,57.45 ; 43.9,43.69 v1(43.9,45.15)
  Bottom Layer w0.14: v1(43.9,45.15) 41.55,42.8 41.55,38.63 51.78,28.4 58,28.4 60.15,30.56 60.15,49.7 v1(67.9,57.45)
DAC2_PRSL_G: length 2.3
  Top Layer w0.14: R14.2 J6.17
DAC2_RSTL: length 55.4
  Top Layer w0.14: 68.8,49.83 68.43,49.46 v1(67.9,49.46) ; J2.9 41.9,39.92 v1(40,38.02) ; 67.26,49.83 R17.1
  Bottom Layer w0.14: v1(67.9,49.46) 61.2,42.76 61.2,30.12 58.43,27.35 50.67,27.35 v1(40,38.02)
DAC2_RSTL_G: length 2.3
  Top Layer w0.14: R17.2 J6.20
DAC2_SCL: length 57.4
  Top Layer w0.14: J2.11 43.5,38.64 v1(42.16,37.3) ; v1(67.9,54.54) 68.43,54.54 68.8,54.91 ; 67.26,54.91 R15.1
  Bottom Layer w0.14: v1(42.16,37.3) 51.41,28.05 58.14,28.05 60.5,30.41 60.5,47.14 v1(67.9,54.54)
DAC2_SCL_G: length 2.3
  Top Layer w0.14: R15.2 J6.18
DAC2_SDA: length 59.5
  Top Layer w0.14: v1(44,36.9) 44.3,37.2 J2.12 ; v1(67.9,59.99) R13.1 ; v1(67.9,59.99) 67.26,59.99 ; v1(67.9,59.99) 68.8,59.99
  Bottom Layer w0.14: v1(67.9,59.99) 59.8,51.89 59.8,30.7 57.85,28.75 52.15,28.75 v1(44,36.9)
DAC2_SDA_G: length 2.3
  Top Layer w0.14: R13.2 J6.16
DCDC_ADJ: length 7.7
  Top Layer w0.3: 81.3,10.57 81.3,9.4 79.65,7.75 U1.6 U1.6
DCDC_ADJ2: length 1.7
  Top Layer w0.25: R51.2 R52.1
DCDC_EN: length 8.7
  Top Layer w0.5: 66.95,12.17 U1.1
  Top Layer w1.2: 66.95,3.5 66.95,7
DEV_3V3: length 18.1
  Top Layer w0.5: J6.2 75.3,95.55 77.6,95.55
  Top Layer w0.8: 80.4,95.55 85,95.55
  Top Layer w1: 77.6,95.55 80.4,95.55 ; J6.1 J6.2
  Bottom Layer w1: J6.1 J6.2
FAN_12V: length 12.8
  Top Layer w1: 64.25,41.29 61.14,41.29 60.14,42.29 60.14,47.99 59.4,48.73 J7.2
FAN_12V_Q: length 20.5
  Top Layer w1: 64.25,33 F5.1 ; 64.25,17.9 D8.1
FAN_PG: length 3.6
  Top Layer w0.25: R47.1 R48.1 61.35,18.45
FAN_PWM: length 2.8
  Top Layer w0.2: J8.15 Q3.1
FAN_PWM_OUT: length 53.4
  Top Layer w0.25: v3(91.6,63.48) 92.6,63.48
  Bottom Layer w0.14: v3(91.6,63.48) 89.71,63.48 81.77,71.42 61.62,71.42 59.2,69 59.2,55.11 J7.4
FAN_PWR_EN: length 48.8
  Top Layer w0.25: 62.7,22.95 v1(62.7,30.6) ; 62.7,22.95 61.6,22.95 ; 62.7,22.95 62.7,21.21
  Bottom Layer w0.2: v1(62.7,30.6) 62.9,30.8 62.9,41.9 69.5,48.5 69.5,62.57 J6.14
FAN_SW_N: length 2.7
  Top Layer w0.25: 59.6,21.21 Q2.3
FAN_TACH: length 2.1
  Top Layer w0.14: J6.15 R28.2
FAN_TACH_RAW: length 40.7
  Top Layer w0.14: R28.1 v3(75.77,62.53) R44.2
  Bottom Layer w0.14: J7.3 60.6,53.97 60.6,68.18 61.3,68.88 74.6,68.88 75.77,67.71 v3(75.77,62.53)
LED_DAC1: length 138.2
  Top Layer w0.14: v1(2.2,4.26) 3.12,4.26
  Bottom Layer w0.14: J8.18 96,53.51 96,24 84,12 65.6,12 65,11.4 65,4.86 64.4,4.26 v1(2.2,4.26)
LED_DAC1_A: length 2.6
  Top Layer w0.14: D3.1 4.1,2.2 4.1,4 3.98,4.26
LED_DAC2: length 86.5
  Top Layer w0.14: 56.72,4.26 56.48,4.26 v1(55.9,4.84)
  Bottom Layer w0.14: J8.17 95.6,55.65 95.6,24.45 83.75,12.6 65,12.6 64.4,12 64.4,5.44 63.8,4.84 v1(55.9,4.84)
LED_DAC2_A: length 2.6
  Top Layer w0.14: D4.1 57.7,2.2 57.7,4 R54.2
LED_OPT1: length 103.3
  Top Layer w0.14: v1(2.2,95.75) 3.12,95.75 ; v1(96.2,96.2) 96.2,91.67 J8.4
  Bottom Layer w0.14: v1(2.2,95.75) 3.12,96.67 67.23,96.67 69.62,94.28 76.08,94.28 78,96.2 v1(96.2,96.2)
LED_OPT1_A: length 2.6
  Top Layer w0.14: D5.1 4,97.8 4,96 3.98,95.76
LED_OPT2: length 48.5
  Top Layer w0.14: v1(55.9,95.18) 56.47,95.75 R2.1
  Bottom Layer w0.14: J8.5 90.03,95.3 78.3,95.3 74.74,91.74 67,91.74 63.56,95.18 v1(55.9,95.18)
LED_OPT2_A: length 2.6
  Top Layer w0.14: D6.1 57.7,97.8 57.7,96 57.58,95.76
OPT1_INTL: length 99.6
  Top Layer w0.14: v3(63.25,78.7) 63.59,79.04 v1(67.95,79.04) ; R37.2 93.23,77.77 ; 93.23,77.77 94.4,77.77 ; 93.23,77.77 v1(93.23,76.87) ; 17.68,56.31 v1(17.68,54.85)
  Bottom Layer w0.14: v1(17.68,54.85) 17.15,55.38 17.15,62 18.16,63.01 18.16,64 17.79,64.37 17.79,69.39 22.95,74.55 29.12,74.55 32.12,77.55 52.54,77.55 53.69,78.7 v3(63.25,78.7) ; v1(93.23,76.87) 91.06,79.04 v1(67.95,79.04)
OPT1_INTL_G: length 2.1
  Top Layer w0.14: R42.2 J8.9
OPT1_PRSL: length 102
  Top Layer w0.14: 16.88,56.31 v1(16.88,54.85) ; v1(93.23,81.95) 93.23,82.85 ; 93.23,82.85 R40.1 ; 93.23,82.85 R35.2 ; v3(63.25,84.12) v1(67.95,84.12)
  Bottom Layer w0.14: v1(16.88,54.85) 16.72,55.01 16.72,64 17.09,64.37 17.09,69.67 22.67,75.25 28.84,75.25 31.84,78.25 52.25,78.25 53.41,79.4 58.53,79.4 v3(63.25,84.12) ; v1(67.95,84.12) 91.06,84.12 v1(93.23,81.95)
OPT1_PRSL_G: length 2.1
  Top Layer w0.14: 95.26,82.85 J8.7
OPT1_RSTL: length 93.7
  Top Layer w0.14: v1(93.23,74.33) 93.23,75.23 ; 93.23,75.23 R43.1 ; 93.23,75.23 R38.2 ; v3(63.25,76.5) v1(67.9,76.5) ; J3.9 v1(18.88,63.6)
  Bottom Layer w0.14: v1(18.88,63.6) 18.88,65 18.14,65.74 18.14,69.24 23.1,74.2 29.27,74.2 32.27,77.2 52.69,77.2 53.84,78.35 61.4,78.35 v3(63.25,76.5) ; v1(67.9,76.5) 91.06,76.5 v1(93.23,74.33)
OPT1_RSTL_G: length 2.1
  Top Layer w0.14: 95.26,75.23 J8.10
OPT1_SCL: length 94.9
  Top Layer w0.14: R36.2 93.23,80.31 ; 93.23,80.31 v1(93.23,79.41) ; 93.23,80.31 94.4,80.31 ; v1(17.44,63) 17.28,62.84 J3.11 ; v3(63.25,81.58) v1(67.95,81.58)
  Bottom Layer w0.14: v1(17.44,63) 17.44,69.53 22.81,74.9 28.98,74.9 31.98,77.9 52.4,77.9 53.55,79.05 60.72,79.05 v3(63.25,81.58) ; v1(67.95,81.58) 91.06,81.58 v1(93.23,79.41)
OPT1_SCL_G: length 2.1
  Top Layer w0.14: R41.2 J8.8
OPT1_SDA: length 98.3
  Top Layer w0.14: v1(93.23,84.49) 93.23,85.39 ; 93.23,85.39 R34.2 ; 93.23,85.39 94.4,85.39 ; J3.12 16.48,62.52 v1(16,63) ; v3(63.25,86.66) v1(67.95,86.66)
  Bottom Layer w0.14: v1(67.95,86.66) 91.06,86.66 v1(93.23,84.49) ; v3(63.25,86.66) 56.34,79.75 53.26,79.75 52.11,78.6 31.69,78.6 28.69,75.6 22.52,75.6 16.74,69.82 16.74,65.74 16,65 v1(16,63)
OPT1_SDA_G: length 2.1
  Top Layer w0.14: R39.2 J8.6
OPT2_INTL: length 53.4
  Top Layer w0.14: J4.28 v1(41.9,54.85) ; 67.26,82.85 v1(67.9,82.85) ; v1(67.9,82.85) 68.8,82.85 ; v1(67.9,82.85) R6.1
  Bottom Layer w0.14: v1(41.9,54.85) 41.37,55.38 41.37,62 42.38,63.01 42.38,64 42.01,64.37 42.01,69.78 46.78,74.55 63.82,74.55 65.5,76.22 65.5,80.45 v1(67.9,82.85)
OPT2_INTL_G: length 2.3
  Top Layer w0.14: R6.2 J6.7
OPT2_PRSL: length 58.2
  Top Layer w0.14: J4.27 v1(41.1,54.85) ; 67.26,87.93 v1(67.9,87.93) ; v1(67.9,87.93) R4.1 ; v1(67.9,87.93) 68.8,87.93
  Bottom Layer w0.14: v1(67.9,87.93) 64.8,84.83 64.8,76.52 63.53,75.25 46.49,75.25 41.31,70.08 41.31,64.37 40.94,64 40.94,55.01 v1(41.1,54.85)
OPT2_PRSL_G: length 2.3
  Top Layer w0.14: R4.2 J6.5
OPT2_RSTL: length 44.8
  Top Layer w0.14: 67.26,80.31 v1(67.9,80.31) ; v1(67.9,80.31) 68.8,80.31 ; v1(67.9,80.31) R7.1 ; 43.1,58.82 v1(43.1,63.6)
  Bottom Layer w0.14: v1(43.1,63.6) 43.1,65 42.36,65.74 42.36,69.64 46.92,74.2 63.97,74.2 65.85,76.08 65.85,78.26 v1(67.9,80.31)
OPT2_RSTL_G: length 2.3
  Top Layer w0.14: R7.2 J6.8
OPT2_SCL: length 49.9
  Top Layer w0.14: 67.26,85.39 v1(67.9,85.39) ; v1(67.9,85.39) R5.1 ; v1(67.9,85.39) 68.8,85.39 ; v1(41.66,63) 41.5,62.84 41.5,58.82
  Bottom Layer w0.14: v1(41.66,63) 41.66,69.93 46.63,74.9 63.68,74.9 65.15,76.37 65.15,82.64 v1(67.9,85.39)
OPT2_SCL_G: length 2.3
  Top Layer w0.14: R5.2 J6.6
OPT2_SDA: length 56.7
  Top Layer w0.14: 67.26,90.47 R3.1 68.55,90.72 v1(68.55,91.2) ; v1(40.22,63) 40.7,62.52 40.7,58.82
  Bottom Layer w0.14: v1(68.55,91.2) 64.45,87.1 64.45,76.66 63.39,75.6 46.34,75.6 40.96,70.22 40.96,65.74 40.22,65 v1(40.22,63)
OPT2_SDA_G: length 2.3
  Top Layer w0.14: R3.2 J6.4
P1_N2O_L1_N: length 19.6
  Top Layer w0.13: 24.88,56.31 24.88,55.31 24.62,55.05 24.62,54.76 25.82,53.56 25.82,53.36 v1(26.08,53.1) ; v1(24.88,39.96) J1.18
  Bottom Layer w0.13: v1(26.08,53.1) 25.82,52.84 25.82,51.06 26.52,50.36 26.52,49.94 25.82,49.24 25.82,44.04 24.62,42.84 24.62,40.22 v1(24.88,39.96)
P1_N2O_L1_P: length 19.6
  Top Layer w0.13: v1(24.08,39.96) J1.17 ; 24.08,56.31 24.08,55.31 24.34,55.05 24.34,54.64 25.54,53.44 25.54,53.36 v1(25.28,53.1)
  Bottom Layer w0.13: v1(24.08,39.96) 24.34,40.22 24.34,42.96 25.54,44.16 25.54,49.36 26.24,50.06 26.24,50.24 25.54,50.94 25.54,52.84 v1(25.28,53.1)
P1_N2O_L2_N: length 19.6
  Top Layer w0.13: J3.2 v1(24.48,60.04) ; v1(24.48,44.92) 24.48,43.69
  Bottom Layer w0.13: v1(24.48,60.04) 24.22,59.78 24.22,59.36 25.92,57.66 25.92,57.24 24.22,55.54 24.22,53.25 24.72,52.75 24.72,46.04 24.22,45.54 24.22,45.18 v1(24.48,44.92)
P1_N2O_L2_P: length 19.6
  Top Layer w0.13: v1(23.68,44.92) 23.68,43.69 ; J3.3 v1(23.68,60.04)
  Bottom Layer w0.13: v1(23.68,44.92) 23.94,45.18 23.94,45.66 24.44,46.16 24.44,52.63 23.94,53.13 23.94,55.66 25.64,57.36 25.64,57.54 23.94,59.24 23.94,59.78 v1(23.68,60.04)
P1_N2O_L3_N: length 19.5
  Top Layer w0.13: v1(22.18,52.6) 21.92,52.86 21.92,53.01 21.22,53.71 21.22,53.89 22.22,54.89 22.22,55.05 22.48,55.31 22.48,56.31 ; v1(22.48,39.96) J1.15
  Bottom Layer w0.13: v1(22.18,52.6) 21.92,52.34 21.92,51.5 22.02,51.4 22.02,47.86 23.02,46.86 23.02,44.04 22.22,43.24 22.22,40.22 v1(22.48,39.96)
P1_N2O_L3_P: length 19.5
  Top Layer w0.13: v1(21.38,52.6) 21.64,52.86 21.64,52.89 20.94,53.59 20.94,54.01 21.94,55.01 21.94,55.05 21.68,55.31 21.68,56.31 ; v1(21.68,39.96) J1.14
  Bottom Layer w0.13: v1(21.68,39.96) 21.94,40.22 21.94,43.36 22.74,44.16 22.74,46.74 21.74,47.74 21.74,51.28 21.64,51.38 21.64,52.34 v1(21.38,52.6)
P1_N2O_L4_N: length 19.9
  Top Layer w0.13: J3.5 v1(22.08,60.04) ; v1(22.08,44.92) 22.08,43.69
  Bottom Layer w0.13: v1(22.08,44.92) 21.82,45.18 21.82,45.53 19.32,48.03 19.32,51.44 21.82,53.94 21.82,59.78 v1(22.08,60.04)
P1_N2O_L4_P: length 19.9
  Top Layer w0.13: J3.6 v1(21.28,60.04) ; v1(21.28,44.92) 21.28,43.69
  Bottom Layer w0.13: v1(21.28,60.04) 21.54,59.78 21.54,54.06 19.04,51.56 19.04,47.92 21.54,45.42 21.54,45.18 v1(21.28,44.92)
P1_O2N_L1_N: length 19.6
  Top Layer w0.13: v1(11.68,60.04) J3.18 ; 11.68,43.69 11.68,44.69 11.94,44.95 11.94,45.24 10.74,46.44 10.74,46.64 v1(10.48,46.9)
  Bottom Layer w0.13: v1(11.68,60.04) 11.94,59.78 11.94,57.16 10.74,55.96 10.74,50.76 10.04,50.06 10.04,49.64 10.74,48.94 10.74,47.16 v1(10.48,46.9)
P1_O2N_L1_P: length 19.6
  Top Layer w0.13: 12.48,43.69 12.48,44.69 12.22,44.95 12.22,45.36 11.02,46.56 11.02,46.64 v1(11.28,46.9) ; v1(12.48,60.04) J3.17
  Bottom Layer w0.13: v1(11.28,46.9) 11.02,47.16 11.02,49.06 10.32,49.76 10.32,49.94 11.02,50.64 11.02,55.84 12.22,57.04 12.22,59.78 v1(12.48,60.04)
P1_O2N_L2_N: length 19.6
  Top Layer w0.13: J1.2 v1(12.08,39.96) ; v1(12.08,55.08) 12.08,56.31
  Bottom Layer w0.13: v1(12.08,39.96) 12.34,40.22 12.34,40.64 10.64,42.34 10.64,42.76 12.34,44.46 12.34,46.75 11.84,47.25 11.84,53.96 12.34,54.46 12.34,54.82 v1(12.08,55.08)
P1_O2N_L2_P: length 19.6
  Top Layer w0.13: v1(12.88,55.08) 12.88,56.31 ; J1.3 v1(12.88,39.96)
  Bottom Layer w0.13: v1(12.88,39.96) 12.62,40.22 12.62,40.76 10.92,42.46 10.92,42.64 12.62,44.34 12.62,46.87 12.12,47.37 12.12,53.84 12.62,54.34 12.62,54.82 v1(12.88,55.08)
P1_O2N_L3_N: length 19.5
  Top Layer w0.13: v1(14.08,60.04) J3.15 ; v1(14.38,47.4) 14.64,47.14 14.64,46.99 15.34,46.29 15.34,46.11 14.34,45.11 14.34,44.95 14.08,44.69 14.08,43.69
  Bottom Layer w0.13: v1(14.38,47.4) 14.64,47.66 14.64,48.5 14.54,48.6 14.54,52.14 13.54,53.14 13.54,55.96 14.34,56.76 14.34,59.78 v1(14.08,60.04)
P1_O2N_L3_P: length 19.5
  Top Layer w0.13: v1(15.18,47.4) 14.92,47.14 14.92,47.11 15.62,46.41 15.62,45.99 14.62,44.99 14.62,44.95 14.88,44.69 14.88,43.69 ; v1(14.88,60.04) J3.14
  Bottom Layer w0.13: v1(14.88,60.04) 14.62,59.78 14.62,56.64 13.82,55.84 13.82,53.26 14.82,52.26 14.82,48.72 14.92,48.62 14.92,47.66 v1(15.18,47.4)
P1_O2N_L4_N: length 19.9
  Top Layer w0.13: J1.5 v1(14.48,39.96) ; v1(14.48,55.08) 14.48,56.31
  Bottom Layer w0.13: v1(14.48,39.96) 14.74,40.22 14.74,46.06 17.24,48.56 17.24,51.97 14.74,54.47 14.74,54.82 v1(14.48,55.08)
P1_O2N_L4_P: length 19.9
  Top Layer w0.13: J1.6 v1(15.28,39.96) ; v1(15.28,55.08) 15.28,56.31
  Bottom Layer w0.13: v1(15.28,39.96) 15.02,40.22 15.02,45.94 17.52,48.44 17.52,52.08 15.02,54.58 15.02,54.82 v1(15.28,55.08)
P2_N2O_L1_N: length 19.6
  Top Layer w0.13: J4.37 49.1,55.31 48.84,55.05 48.84,54.76 50.04,53.56 50.04,53.36 v1(50.3,53.1) ; v1(49.1,39.96) J2.18
  Bottom Layer w0.13: v1(49.1,39.96) 48.84,40.22 48.84,42.84 50.04,44.04 50.04,49.24 50.74,49.94 50.74,50.36 50.04,51.06 50.04,52.84 v1(50.3,53.1)
P2_N2O_L1_P: length 19.6
  Top Layer w0.13: v1(49.5,53.1) 49.76,53.36 49.76,53.44 48.56,54.64 48.56,55.05 48.3,55.31 J4.36 ; v1(48.3,39.96) J2.17
  Bottom Layer w0.13: v1(49.5,53.1) 49.76,52.84 49.76,50.94 50.46,50.24 50.46,50.06 49.76,49.36 49.76,44.16 48.56,42.96 48.56,40.22 v1(48.3,39.96)
P2_N2O_L2_N: length 19.6
  Top Layer w0.13: v1(48.7,44.92) 48.7,43.69 ; 48.7,58.82 v1(48.7,60.04)
  Bottom Layer w0.13: v1(48.7,44.92) 48.44,45.18 48.44,45.54 48.94,46.04 48.94,52.75 48.44,53.25 48.44,55.54 50.14,57.24 50.14,57.66 48.44,59.36 48.44,59.78 v1(48.7,60.04)
P2_N2O_L2_P: length 19.6
  Top Layer w0.13: 47.9,58.82 v1(47.9,60.04) ; v1(47.9,44.92) 47.9,43.69
  Bottom Layer w0.13: v1(47.9,44.92) 48.16,45.18 48.16,45.66 48.66,46.16 48.66,52.63 48.16,53.13 48.16,55.66 49.86,57.36 49.86,57.54 48.16,59.24 48.16,59.78 v1(47.9,60.04)
P2_N2O_L3_N: length 19.5
  Top Layer w0.13: J4.34 46.7,55.31 46.44,55.05 46.44,54.89 45.44,53.89 45.44,53.71 46.14,53.01 46.14,52.86 v1(46.4,52.6) ; v1(46.7,39.96) J2.15
  Bottom Layer w0.13: v1(46.7,39.96) 46.44,40.22 46.44,43.24 47.24,44.04 47.24,46.86 46.24,47.86 46.24,51.4 46.14,51.5 46.14,52.34 v1(46.4,52.6)
P2_N2O_L3_P: length 19.5
  Top Layer w0.13: v1(45.9,39.96) J2.14 ; v1(45.6,52.6) 45.86,52.86 45.86,52.89 45.16,53.59 45.16,54.01 46.16,55.01 46.16,55.05 45.9,55.31 J4.33
  Bottom Layer w0.13: v1(45.9,39.96) 46.16,40.22 46.16,43.36 46.96,44.16 46.96,46.74 45.96,47.74 45.96,51.28 45.86,51.38 45.86,52.34 v1(45.6,52.6)
P2_N2O_L4_N: length 19.9
  Top Layer w0.13: 46.3,58.82 v1(46.3,60.04) ; v1(46.3,44.92) 46.3,43.69
  Bottom Layer w0.13: v1(46.3,44.92) 46.04,45.18 46.04,45.53 43.54,48.03 43.54,51.44 46.04,53.94 46.04,59.78 v1(46.3,60.04)
P2_N2O_L4_P: length 19.9
  Top Layer w0.13: v1(45.5,44.92) 45.5,43.69 ; 45.5,58.82 v1(45.5,60.04)
  Bottom Layer w0.13: v1(45.5,44.92) 45.76,45.18 45.76,45.42 43.26,47.92 43.26,51.56 45.76,54.06 45.76,59.78 v1(45.5,60.04)
P2_O2N_L1_N: length 19.6
  Top Layer w0.13: v1(34.7,46.9) 34.96,46.64 34.96,46.44 36.16,45.24 36.16,44.95 35.9,44.69 35.9,43.69 ; v1(35.9,60.04) 35.9,58.82
  Bottom Layer w0.13: v1(34.7,46.9) 34.96,47.16 34.96,48.94 34.26,49.64 34.26,50.06 34.96,50.76 34.96,55.96 36.16,57.16 36.16,59.78 v1(35.9,60.04)
P2_O2N_L1_P: length 19.6
  Top Layer w0.13: 36.7,43.69 36.7,44.69 36.44,44.95 36.44,45.36 35.24,46.56 35.24,46.64 v1(35.5,46.9) ; v1(36.7,60.04) 36.7,58.82
  Bottom Layer w0.13: v1(36.7,60.04) 36.44,59.78 36.44,57.04 35.24,55.84 35.24,50.64 34.54,49.94 34.54,49.76 35.24,49.06 35.24,47.16 v1(35.5,46.9)
P2_O2N_L2_N: length 19.6
  Top Layer w0.13: v1(36.3,55.08) J4.21 ; J2.2 v1(36.3,39.96)
  Bottom Layer w0.13: v1(36.3,39.96) 36.56,40.22 36.56,40.64 34.86,42.34 34.86,42.76 36.56,44.46 36.56,46.75 36.06,47.25 36.06,53.96 36.56,54.46 36.56,54.82 v1(36.3,55.08)
P2_O2N_L2_P: length 19.6
  Top Layer w0.13: v1(37.1,55.08) J4.22 ; J2.3 v1(37.1,39.96)
  Bottom Layer w0.13: v1(37.1,39.96) 36.84,40.22 36.84,40.76 35.14,42.46 35.14,42.64 36.84,44.34 36.84,46.87 36.34,47.37 36.34,53.84 36.84,54.34 36.84,54.82 v1(37.1,55.08)
P2_O2N_L3_N: length 19.5
  Top Layer w0.13: 38.3,43.69 38.3,44.69 38.56,44.95 38.56,45.11 39.56,46.11 39.56,46.29 38.86,46.99 38.86,47.14 v1(38.6,47.4) ; v1(38.3,60.04) 38.3,58.82
  Bottom Layer w0.13: v1(38.6,47.4) 38.86,47.66 38.86,48.5 38.76,48.6 38.76,52.14 37.76,53.14 37.76,55.96 38.56,56.76 38.56,59.78 v1(38.3,60.04)
P2_O2N_L3_P: length 19.5
  Top Layer w0.13: v1(39.1,60.04) 39.1,58.82 ; v1(39.4,47.4) 39.14,47.14 39.14,47.11 39.84,46.41 39.84,45.99 38.84,44.99 38.84,44.95 39.1,44.69 39.1,43.69
  Bottom Layer w0.13: v1(39.1,60.04) 38.84,59.78 38.84,56.64 38.04,55.84 38.04,53.26 39.04,52.26 39.04,48.72 39.14,48.62 39.14,47.66 v1(39.4,47.4)
P2_O2N_L4_N: length 19.9
  Top Layer w0.13: J2.5 v1(38.7,39.96) ; v1(38.7,55.08) J4.24
  Bottom Layer w0.13: v1(38.7,39.96) 38.96,40.22 38.96,46.06 41.46,48.56 41.46,51.97 38.96,54.47 38.96,54.82 v1(38.7,55.08)
P2_O2N_L4_P: length 19.9
  Top Layer w0.13: v1(39.5,55.08) J4.25 ; J2.6 v1(39.5,39.96)
  Bottom Layer w0.13: v1(39.5,39.96) 39.24,40.22 39.24,45.94 41.74,48.44 41.74,52.08 39.24,54.58 39.24,54.82 v1(39.5,55.08)
PWR_LED_A: length 1.7
  Top Layer w0.25: 98.2,20.9 D7.1

## Copper pours and planes (outline as drawn; the poured copper is in the pictures)
+3V3 on Top Layer: 75.65,1.6 75.65,19.67 76.4,20.42 79.4,20.42 80.2,19.62 80.2,9.9 78.6,8.3 78.6,1.6
+3V3 on Inner2: 0.5,0.5 0.5,99.5 99.5,99.5 99.5,0.5
GND on Top Layer: 70.35,1.6 70.35,11.6 75.4,11.6 75.4,1.6
GND on Top Layer: 83.96,18.83 83.96,17.41 82.96,16.41 81.54,16.41 80.54,17.41 80.54,18.83 81.54,19.83 82.96,19.83
GND on Inner1: 0.5,0.5 0.5,99.5 99.5,99.5 99.5,0.5
GND on Inner2: 32,38 32,62 53,62 53,38
GND on Inner2: 7.78,38 7.78,62 28.78,62 28.78,38
VCC_DAC1 on Inner2: 2,39.4 17.7,39.4 17.7,40.7 19.3,40.7 19.3,39.4 21.5,39.4 21.5,33.6 7.3,33.6 7.3,27.6 2,27.6
VCC_DAC2 on Inner2: 39,39.4 41.9,39.4 41.9,40.7 43.5,40.7 43.5,39.4 58.78,39.4 58.78,27.6 53.48,27.6 53.48,33.6 39,33.6
VCC_OPT1 on Inner2: 2,60.6 2,72.4 7.3,72.4 7.3,66.4 21.5,66.4 21.5,60.6 18.9,60.6 18.9,59.3 17.3,59.3 17.3,60.6
VCC_OPT2 on Inner2: 39,60.6 39,66.4 53.48,66.4 53.48,72.4 58.78,72.4 58.78,60.6 43.1,60.6 43.1,59.3 41.5,59.3 41.5,60.6

Small or netless copper shapes (teardrops, artwork), in the pictures only: 182 on Top Layer, 3 on Bottom Layer

## Text on the board
Top Silkscreen Layer: C6-C10 | C16-C20 | C11-C15 | C21-C25 | C27-C28 | PWM | TAC | 12V | GND | ADJ | ESP32-S3 USB-C | ANTENNA | 12V DC | PWR | 3V3 | ZXDN10 | LABEL | github.com/cyyself/ | qsfp-booster
